# Altium schematic sheet 12.SATA接口.SchDoc
size A4; SheetNumber: 12; SheetTotal: 13
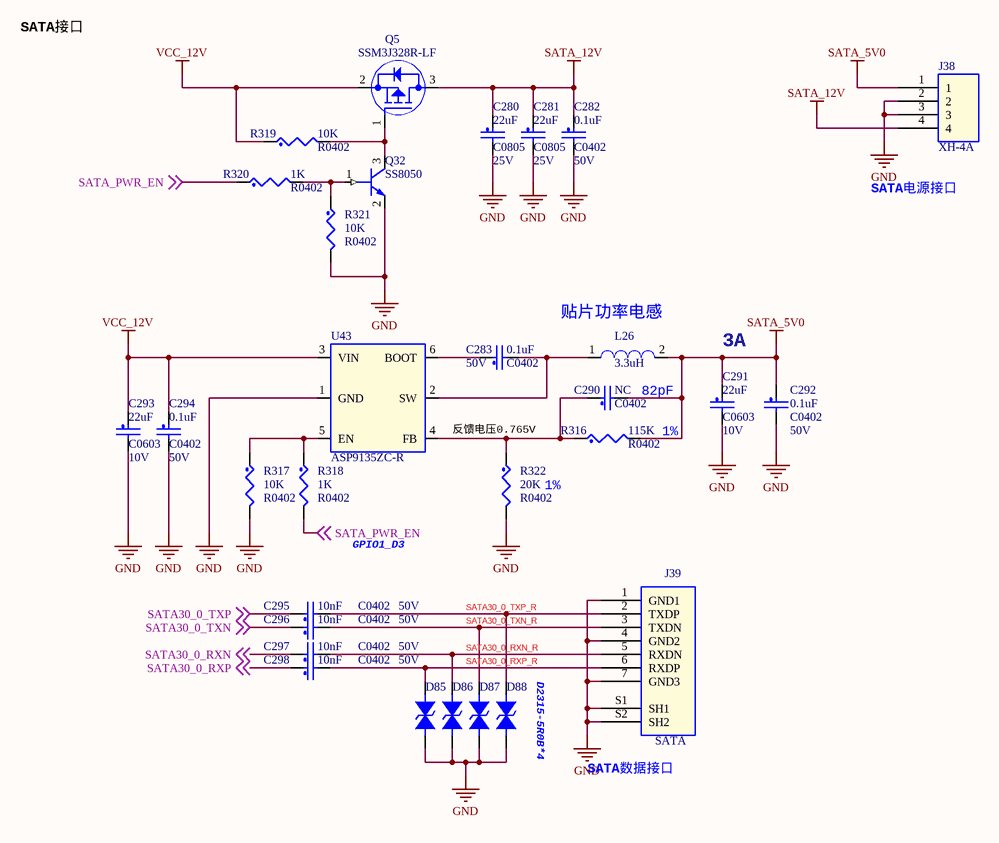
[diagram p0: 12.SATA接口.SchDoc]

## Parts
C280  22uF  Voltage: 25V  [C0805]
C281  22uF  Voltage: 25V  [C0805]
C282  0.1uF  Voltage: 50V  [C0402]
C283  0.1uF  Voltage: 50V  [C0402]
C290  NC  [C0402]
C291  22uF  Voltage: 10V  [C0603]
C292  0.1uF  Voltage: 50V  [C0402]
C293  22uF  Voltage: 10V  [C0603]
C294  0.1uF  Voltage: 50V  [C0402]
C295  10nF  Voltage: 50V  [C0402]
C296  10nF  Voltage: 50V  [C0402]
C297  10nF  Voltage: 50V  [C0402]
C298  10nF  Voltage: 50V  [C0402]
D85  D2315-5R0B  [esd0402]  (value not drawn)
D86  D2315-5R0B  [esd0402]  (value not drawn)
D87  D2315-5R0B  [esd0402]  (value not drawn)
D88  D2315-5R0B  [esd0402]  (value not drawn)
J38  XH-4A  [XH2p54-4p]
J39  SATA  [ssata_v]
L26  3.3uH  [l4520]
Q5  SSM3J328R-LF  [SOT23]
Q32  SS8050  [SOT23]
R316  115K  [R0402]
R317  10K  [R0402]
R318  1K  [R0402]
R319  10K  [R0402]
R320  1K  [R0402]
R321  10K  [R0402]
R322  20K  [R0402]
U43  ASP9135ZC-R  [SOT23_6]

## Nets
GND: C280.2 C281.2 C282.2 C291.2 C292.2 C293.2 C294.2 D85.1 D86.1 D87.1 D88.1 J38.2 J38.3 J39.1(GND1) J39.4(GND2) J39.7(GND3) J39.S1(SH1) J39.S2(SH2) Q32.2(EMITTER) R317.2 R321.2 R322.2 U43.1(GND)
SATA_5V0: C290.2 C291.1 C292.1 J38.1 L26.2 R316.2
SATA_12V: C280.1 C281.1 C282.1 J38.4 Q5.3(DRAIN)
VCC_12V: C293.1 C294.1 Q5.2(SOURCE) R319.1 U43.3(VIN)
SATA30_0_RXN: C297.1 ; off-sheet SATA30_0_RXN
SATA30_0_RXN_R: C297.2 D86.2 J39.5(RXDN)
SATA30_0_RXP: C298.1 ; off-sheet SATA30_0_RXP
SATA30_0_RXP_R: C298.2 D85.2 J39.6(RXDP)
SATA30_0_TXN: C296.1 ; off-sheet SATA30_0_TXN
SATA30_0_TXN_R: C296.2 D87.2 J39.3(TXDN)
SATA30_0_TXP: C295.1 ; off-sheet SATA30_0_TXP
SATA30_0_TXP_R: C295.2 D88.2 J39.2(TXDP)
SATA_PWR_EN: R318.2 R320.1 ; off-sheet SATA_PWR_EN
NetC283_1: C283.1 U43.6(BOOT)
NetC283_2: C283.2 L26.1 U43.2(SW)
NetC290_1: C290.1 R316.1 R322.1 U43.4(FB)
NetQ5_1: Q5.1(GATE) Q32.3(COLLECTOR) R319.2
NetQ32_1: Q32.1(BASE) R320.2 R321.1
NetR317_1: R317.1 R318.1 U43.5(EN)

## Notes on the sheet
- SATA接口
- SATA电源接口
- (near L26) 贴片功率电感
- 3A
- 反馈电压0.765V
- 82pF
- 1%
- GPIO1_D3
- (near D88) D2315-5R0B*4
- (near J39) SATA数据接口

## Library data of the parts
C280 C281 = CAP_NP: CLASS: DISCRETE; 规格: 贴片电容22uF 20% 25V X5R 0805; 规格编号: 0805X226M250NT; 条码: EBF29060173; 品牌: 风华; 类别: 贴片电容0805; 规格书: 风华电容.pdf; 价格: 0.285631; 生命周期: 量产; PCB Footprint: C0805
C282 C283 = CAP_NP: CLASS: DISCRETE; 生命周期: 量产; 价格: 0.029826; 规格书: 风华电容.pdf; 类别: 贴片电容0402; 品牌: 风华; 条码: EBF29060118; 规格编号: 0402X104K500NT; 规格: 贴片电容0.1uF 10% 50V X5R 0402; PCB Footprint: C0402
C290 = CAP_NP: CLASS: DISCRETE; 规格: 贴片电容NC 预留; 条码: EBF29060149; 类别: 贴片电容0402; Voltage: NC; PCB Footprint: C0402
C291 C293 = CAP_NP: CLASS: DISCRETE; 生命周期: 量产; 价格: 0.078818; 规格书: 三星电容.pdf; 类别: 贴片电容0603; 品牌: 三星; 条码: EBF29060163; 规格编号: CL10A226MP8NUNE; 规格: 贴片电容22uF 20% 10V X5R 0603; PCB Footprint: C0603
C292 C294 = CAP_NP: CLASS: DISCRETE; 规格: 贴片电容0.1uF 10% 50V X5R 0402; 规格编号: 0402X104K500NT; 条码: EBF29060118; 品牌: 风华; 类别: 贴片电容0402; 规格书: 风华电容.pdf; 价格: 0.029826; 生命周期: 量产; PCB Footprint: C0402
C295-C298 = CAP_NP: CLASS: DISCRETE; 规格: 贴片电容10nF 10% 50V X7R 0402; 规格编号: CC0402KRX7R9BB103; 条码: EBF29060245; 品牌: 国巨; 类别: 贴片电容0402; 规格书: 国巨-贴片电容.pdf; 价格: 0.003808; 生命周期: 量产; PCB Footprint: C0402
D85-D88 = DIODE BI-DIR TRIG: 备注: 通用; 生命周期: 量产; 规格书: 千虹_D2315-5R0B.pdf; 类别: 贴片ESD; 品牌: 千虹; 条码: EBFCIS240517170922; 规格: 防静电保护ESD二极管 反向工作电压5V 击穿电压7V 钳位电压10.5V 结电容Cj 0.3pF; PCB Footprint: esd0402; 规格编号: D2315-5R0B
J38 = 1X4PIN: 可替代料: EBF29040012; 生命周期: 量产; 价格: 0.041116; 规格书: 博穆精密-XH2.54.pdf; 类别: XH连接器; 品牌: 博穆精密; 规格: 直针XH2.54-4P 间距2.54MM 拔插式 接插件 直插; PCB Footprint: XH2p54-4p; 条码: EBF29040012; 规格编号: XH-4A
J39 = SATA: 生命周期: 量产; 规格书: SATA_7PIN.pdf; 类别: SATA连接器; 品牌: 华宇创; 条码: EBF29040076; 规格编号: HYCW01-SATA07-205B; 规格: SATA 7PIN 全包开窗 A型; PCB Footprint: ssata_v
L26 = IND: CLASS: DISCRETE; 规格: 贴片电感3.3uH ±20% 3A 直流电阻69mΩ; 条码: EBF29050040; 品牌: 台庆; 类别: 贴片电感0402; 规格书: 台庆-功率电感.pdf; 生命周期: 量产; 规格编号: TMPC0402HP-3R3MG-Z02; 价格: 1.5992; PCB Footprint: l4520
Q5 = MOSFET_P: CLASS: IC; 丝印: KFH-XXX; 生命周期: 量产; 价格: 0.447836; 规格书: SSM3J328R-LF.pdf; 类别: P-MOS; 品牌: 东芝; 条码: EBF29280008; 规格编号: SSM3J328R LF; 规格: P沟道MOS 导通电阻29.8mΩ 电流3A 1.5V可驱动; PCB Footprint: SOT23
Q32 = NPN: CLASS: IC; 丝印: Y1; 生命周期: 量产; 价格: 0.086744; 规格书: 江苏长电-SS8050Y1.pdf; 类别: 贴片三极管SOT-23; 品牌: 江苏长电; 条码: EBF29090001; 规格: 贴片三极管SS8050 集电极电流1.5A 额定功率300mW NPN; PCB Footprint: SOT23; 规格编号: SS8050
R316 = RES: CLASS: DISCRETE; 规格: 贴片电阻115K 1% 1/16W 0402; 规格编号: AC0402FR-07115KL; 条码: EBF29070290; 品牌: 国巨; 类别: 贴片电阻0402; 规格书: YAGEO国巨厚膜无铅电阻.pdf; 价格: 0.006087; 生命周期: 量产; PCB Footprint: R0402
R317 R321 = RES: CLASS: DISCRETE; 生命周期: 量产; 价格: 0.002773; 规格书: 厚声-无铅厚膜电阻.pdf; 类别: 贴片电阻0402; 品牌: 厚声; 条码: EBF29070046; 规格编号: 0402WGF1002TCE; 规格: 贴片电阻10K 1% 1/16W 0402; PCB Footprint: R0402
R318 R320 = RES: CLASS: DISCRETE; 规格: 贴片电阻1K 1% 1/16W 0402; 规格编号: RI0402L1001FT; 条码: EBF29070050; 品牌: 合科泰; 类别: 贴片电阻0402; 规格书: 合科泰-RI系列电阻.pdf; 生命周期: 量产; PCB Footprint: R0402
R319 = RES: CLASS: DISCRETE; 规格: 贴片电阻10K 1% 1/16W 0402; 规格编号: 0402WGF1002TCE; 条码: EBF29070046; 品牌: 厚声; 类别: 贴片电阻0402; 规格书: 厚声-无铅厚膜电阻.pdf; 价格: 0.002773; 生命周期: 量产; PCB Footprint: R0402
R322 = RES: CLASS: DISCRETE; 规格: 贴片电阻20K 1% 1/16W 0402; 规格编号: 0402WGF2002TCE; 条码: EBF29070223; 品牌: 厚声; 类别: 贴片电阻0402; 规格书: 厚声-无铅厚膜电阻.pdf; 价格: 0.002473; 生命周期: 量产; PCB Footprint: R0402
U43 = TP6327GS6: 生命周期: 量产; 规格书: 安森德_ASP9135ZC-R.pdf; 类别: 电源管理-DCDC; 品牌: 安森德; 条码: EBFCIS240710113940; 规格: DC-DC电源芯片 可输出电流 3A 开关工作频率 600kHz 输出类型 ADJ 输入电压范围：4V-18V; 备注: RK3566金手指与BTB底板替换物料; 规格编号: ASP9135ZC-R; 可替代料: TP6327GS6; PCB Footprint: SOT23_6